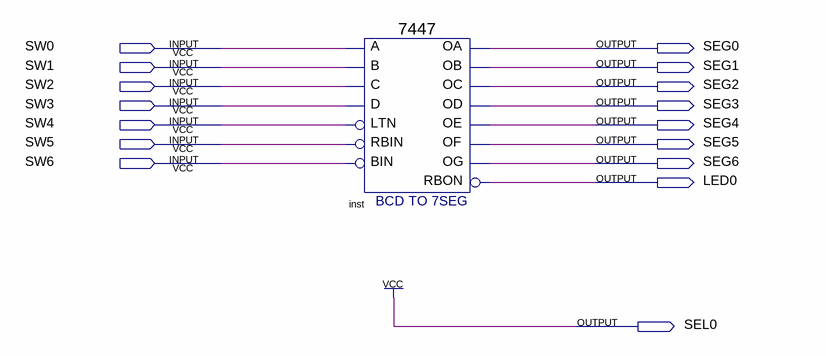
[diagram p0: schematic sheet]
// Quartus schematic CE_7447.bdf as structural Verilog: 1 symbols, 16 pins
module CE_7447 (
  input  SW0,
  input  SW1,
  input  SW2,
  input  SW3,
  input  SW4,
  input  SW5,
  input  SW6,
  output SEG0,
  output SEG1,
  output SEG2,
  output SEG3,
  output SEG4,
  output SEG5,
  output SEG6,
  output LED0,
  output SEL0
);

  \7447  inst (
    .LTN(SW4), .B(SW1), .C(SW2), .D(SW3), .RBIN(SW5), .BIN(SW6), .A(SW0), .OB(SEG1), .OC(SEG2), .OE(SEG4),
    .OD(SEG3), .OF(SEG5), .OG(SEG6), .OA(SEG0), .RBON(LED0));

  assign SEL0 = 1'b1;
endmodule
